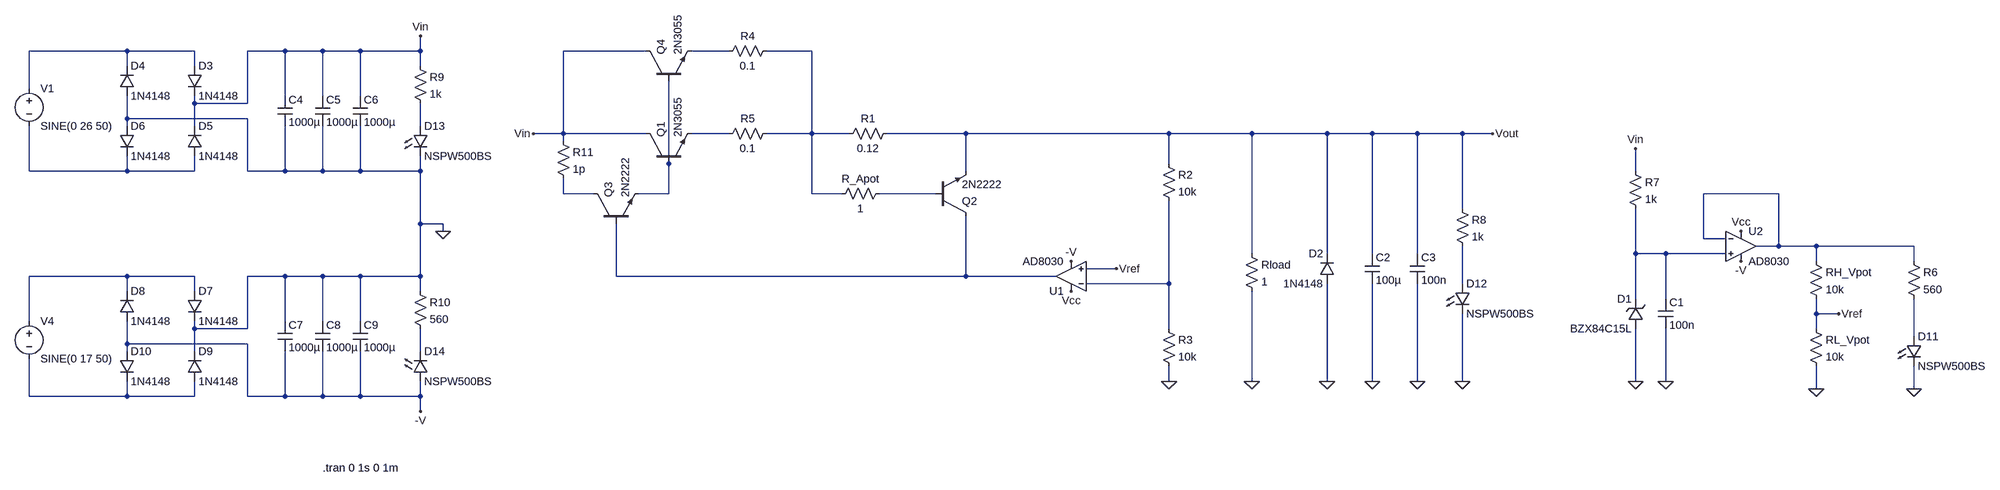
[diagram p0: schematic ALimentatore.asc]
ALimentatore.asc, the LTspice schematic file:
Version 4
SHEET 1 3308 680
WIRE -928 -320 -1136 -320
WIRE -784 -320 -928 -320
WIRE -592 -320 -672 -320
WIRE -512 -320 -592 -320
WIRE -432 -320 -512 -320
WIRE -304 -320 -304 -352
WIRE -304 -320 -432 -320
WIRE 176 -320 0 -320
WIRE 352 -320 272 -320
WIRE 528 -320 432 -320
WIRE -928 -288 -928 -320
WIRE -784 -288 -784 -320
WIRE -304 -288 -304 -320
WIRE -1136 -240 -1136 -320
WIRE -592 -224 -592 -320
WIRE -512 -224 -512 -320
WIRE -432 -224 -432 -320
WIRE -784 -208 -784 -224
WIRE -672 -208 -672 -320
WIRE -672 -208 -784 -208
WIRE -928 -176 -928 -224
WIRE -672 -176 -928 -176
WIRE -928 -160 -928 -176
WIRE -784 -160 -784 -208
WIRE -304 -160 -304 -208
WIRE 0 -144 0 -320
WIRE 0 -144 -64 -144
WIRE 176 -144 0 -144
WIRE 352 -144 272 -144
WIRE 528 -144 528 -320
WIRE 528 -144 432 -144
WIRE 608 -144 528 -144
WIRE 864 -144 688 -144
WIRE 1296 -144 864 -144
WIRE 1472 -144 1296 -144
WIRE 1632 -144 1472 -144
WIRE 1728 -144 1632 -144
WIRE 1824 -144 1728 -144
WIRE 1920 -144 1824 -144
WIRE 1984 -144 1920 -144
WIRE 0 -128 0 -144
WIRE 224 -80 224 -256
WIRE 1296 -80 1296 -144
WIRE -1136 -64 -1136 -160
WIRE -928 -64 -928 -96
WIRE -928 -64 -1136 -64
WIRE -784 -64 -784 -96
WIRE -784 -64 -928 -64
WIRE -672 -64 -672 -176
WIRE -592 -64 -592 -160
WIRE -592 -64 -672 -64
WIRE -512 -64 -512 -160
WIRE -512 -64 -592 -64
WIRE -432 -64 -432 -160
WIRE -432 -64 -512 -64
WIRE -304 -64 -304 -96
WIRE -304 -64 -432 -64
WIRE 864 -64 864 -144
WIRE 2288 -64 2288 -112
WIRE 0 -16 0 -48
WIRE 64 -16 0 -16
WIRE 224 -16 224 -80
WIRE 224 -16 160 -16
WIRE 528 -16 528 -144
WIRE 592 -16 528 -16
WIRE 800 -16 672 -16
WIRE 2592 -16 2432 -16
WIRE 1920 16 1920 -144
WIRE -304 48 -304 -64
WIRE -256 48 -304 48
WIRE -256 64 -256 48
WIRE 2432 80 2432 -16
WIRE 2480 80 2432 80
WIRE 2592 96 2592 -16
WIRE 2592 96 2544 96
WIRE 2672 96 2592 96
WIRE 2880 96 2672 96
WIRE 1472 112 1472 -144
WIRE 1632 112 1632 -144
WIRE 1728 112 1728 -144
WIRE 1824 112 1824 -144
WIRE 2288 112 2288 16
WIRE 2352 112 2288 112
WIRE 2480 112 2352 112
WIRE 2672 128 2672 96
WIRE 2880 128 2880 96
WIRE 1184 144 1120 144
WIRE -928 160 -1136 160
WIRE -784 160 -928 160
WIRE -592 160 -672 160
WIRE -512 160 -592 160
WIRE -432 160 -512 160
WIRE -304 160 -304 48
WIRE -304 160 -432 160
WIRE 112 160 112 48
WIRE 864 160 864 32
WIRE 864 160 112 160
WIRE 1056 160 864 160
WIRE 1296 176 1296 0
WIRE 1296 176 1120 176
WIRE 1920 176 1920 96
WIRE -928 192 -928 160
WIRE -784 192 -784 160
WIRE -304 192 -304 160
WIRE 2288 208 2288 112
WIRE 2352 208 2352 112
WIRE 2672 240 2672 208
WIRE 2720 240 2672 240
WIRE -1136 256 -1136 160
WIRE -592 256 -592 160
WIRE -512 256 -512 160
WIRE -432 256 -432 160
WIRE -784 272 -784 256
WIRE -672 272 -672 160
WIRE -672 272 -784 272
WIRE 1296 272 1296 176
WIRE 2672 272 2672 240
WIRE 2880 288 2880 208
WIRE -928 304 -928 256
WIRE -672 304 -928 304
WIRE -928 320 -928 304
WIRE -784 320 -784 272
WIRE -304 320 -304 272
WIRE 1296 384 1296 352
WIRE 1472 384 1472 192
WIRE 1632 384 1632 176
WIRE 1728 384 1728 176
WIRE 1824 384 1824 176
WIRE 1920 384 1920 240
WIRE 2288 384 2288 272
WIRE 2352 384 2352 272
WIRE 2672 400 2672 352
WIRE 2880 400 2880 352
WIRE -1136 416 -1136 336
WIRE -928 416 -928 384
WIRE -928 416 -1136 416
WIRE -784 416 -784 384
WIRE -784 416 -928 416
WIRE -672 416 -672 304
WIRE -592 416 -592 320
WIRE -592 416 -672 416
WIRE -512 416 -512 320
WIRE -512 416 -592 416
WIRE -432 416 -432 320
WIRE -432 416 -512 416
WIRE -304 416 -304 384
WIRE -304 416 -432 416
WIRE -304 448 -304 416
FLAG 1088 128 -V
FLAG -64 -144 Vin
FLAG 1184 144 Vref
FLAG 1296 384 0
FLAG 1472 384 0
FLAG 1088 192 Vcc
FLAG 2512 128 -V
FLAG 2512 64 Vcc
FLAG 2288 384 0
FLAG 2672 400 0
FLAG 2720 240 Vref
FLAG 1984 -144 Vout
FLAG 2352 384 0
FLAG 1632 384 0
FLAG 1728 384 0
FLAG 1824 384 0
FLAG -304 -352 Vin
FLAG -256 64 0
FLAG -304 448 -V
FLAG 2288 -112 Vin
FLAG 2880 400 0
FLAG 1920 384 0
SYMBOL opamps\\AD8030 1088 224 R180
SYMATTR InstName U1
SYMBOL npn 176 -80 R270
SYMATTR InstName Q1
SYMATTR Value 2N3055
SYMBOL npn 800 32 M180
SYMATTR InstName Q2
SYMATTR Value 2N2222
SYMBOL res 704 -160 R90
WINDOW 0 0 56 VBottom 2
WINDOW 3 32 56 VTop 2
SYMATTR InstName R1
SYMATTR Value 0.12
SYMBOL res 1280 -96 R0
SYMATTR InstName R2
SYMATTR Value 10k
SYMBOL res 1280 256 R0
SYMATTR InstName R3
SYMATTR Value 10k
SYMBOL res 1456 96 R0
SYMATTR InstName Rload
SYMATTR Value 1
SYMBOL npn 64 48 R270
SYMATTR InstName Q3
SYMATTR Value 2N2222
SYMBOL npn 176 -256 R270
SYMATTR InstName Q4
SYMATTR Value 2N3055
SYMBOL res 448 -336 R90
WINDOW 0 0 56 VBottom 2
WINDOW 3 32 56 VTop 2
SYMATTR InstName R4
SYMATTR Value 0.1
SYMBOL res 448 -160 R90
WINDOW 0 0 56 VBottom 2
WINDOW 3 32 56 VTop 2
SYMATTR InstName R5
SYMATTR Value 0.1
SYMBOL opamps\\AD8030 2512 32 R0
SYMATTR InstName U2
SYMBOL zener 2304 272 R180
WINDOW 0 24 64 Left 2
WINDOW 3 24 0 Left 2
SYMATTR InstName D1
SYMATTR Value BZX84C15L
SYMATTR Description Diode
SYMATTR Type diode
SYMBOL res 2272 -80 R0
SYMATTR InstName R7
SYMATTR Value 1k
SYMBOL res 2656 112 R0
SYMATTR InstName RH_Vpot
SYMATTR Value 10k
SYMBOL res 2656 256 R0
SYMATTR InstName RL_Vpot
SYMATTR Value 10k
SYMBOL res 688 -32 R90
WINDOW 0 0 56 VBottom 2
WINDOW 3 32 56 VTop 2
SYMATTR InstName R_Apot
SYMATTR Value 1
SYMBOL cap 2336 208 R0
SYMATTR InstName C1
SYMATTR Value 100n
SYMBOL diode 1648 176 R180
WINDOW 0 24 64 Left 2
WINDOW 3 24 0 Left 2
SYMATTR InstName D2
SYMATTR Value 1N4148
SYMBOL cap 1712 112 R0
SYMATTR InstName C2
SYMATTR Value 100µ
SYMBOL cap 1808 112 R0
SYMATTR InstName C3
SYMATTR Value 100n
SYMBOL voltage -1136 -256 R0
WINDOW 123 0 0 Left 0
WINDOW 39 0 0 Left 0
SYMATTR InstName V1
SYMATTR Value SINE(0 26 50)
SYMBOL voltage -1136 240 R0
WINDOW 123 0 0 Left 0
WINDOW 39 0 0 Left 0
SYMATTR InstName V4
SYMATTR Value SINE(0 17 50)
SYMBOL diode -800 -288 R0
SYMATTR InstName D3
SYMATTR Value 1N4148
SYMBOL diode -944 -224 M180
WINDOW 0 24 64 Left 2
WINDOW 3 24 0 Left 2
SYMATTR InstName D4
SYMATTR Value 1N4148
SYMBOL diode -800 -96 M180
WINDOW 0 24 64 Left 2
WINDOW 3 24 0 Left 2
SYMATTR InstName D5
SYMATTR Value 1N4148
SYMBOL diode -944 -160 R0
SYMATTR InstName D6
SYMATTR Value 1N4148
SYMBOL cap -608 -224 R0
SYMATTR InstName C4
SYMATTR Value 1000µ
SYMBOL cap -528 -224 R0
SYMATTR InstName C5
SYMATTR Value 1000µ
SYMBOL cap -448 -224 R0
SYMATTR InstName C6
SYMATTR Value 1000µ
SYMBOL diode -800 192 R0
SYMATTR InstName D7
SYMATTR Value 1N4148
SYMBOL diode -944 256 M180
WINDOW 0 24 64 Left 2
WINDOW 3 24 0 Left 2
SYMATTR InstName D8
SYMATTR Value 1N4148
SYMBOL diode -800 384 M180
WINDOW 0 24 64 Left 2
WINDOW 3 24 0 Left 2
SYMATTR InstName D9
SYMATTR Value 1N4148
SYMBOL diode -944 320 R0
SYMATTR InstName D10
SYMATTR Value 1N4148
SYMBOL cap -608 256 R0
SYMATTR InstName C7
SYMATTR Value 1000µ
SYMBOL cap -528 256 R0
SYMATTR InstName C8
SYMATTR Value 1000µ
SYMBOL cap -448 256 R0
SYMATTR InstName C9
SYMATTR Value 1000µ
SYMBOL LED 2864 288 R0
SYMATTR InstName D11
SYMATTR Value NSPW500BS
SYMATTR Description Diode
SYMATTR Type diode
SYMBOL res 2864 112 R0
SYMATTR InstName R6
SYMATTR Value 560
SYMBOL LED 1904 176 R0
SYMATTR InstName D12
SYMATTR Value NSPW500BS
SYMATTR Description Diode
SYMATTR Type diode
SYMBOL res 1904 0 R0
SYMATTR InstName R8
SYMATTR Value 1k
SYMBOL LED -320 -160 R0
SYMATTR InstName D13
SYMATTR Value NSPW500BS
SYMATTR Description Diode
SYMATTR Type diode
SYMBOL res -320 -304 R0
SYMATTR InstName R9
SYMATTR Value 1k
SYMBOL LED -320 384 M180
WINDOW 0 24 64 Left 2
WINDOW 3 24 0 Left 2
SYMATTR InstName D14
SYMATTR Value NSPW500BS
SYMATTR Description Diode
SYMATTR Type diode
SYMBOL res -320 176 R0
SYMATTR InstName R10
SYMATTR Value 560
SYMBOL res -16 -144 R0
SYMATTR InstName R11
SYMATTR Value 1p
TEXT -512 568 Left 2 !.tran 0 1s 0 1m

The netlist it stands for:
* ALimentatore.asc
XU1 Vref N014 Vcc -V N013 AD8040  ; AD8030, pins In+ In- V+ V- OUT
Q1 Vin N006 N005 0 2N3055
Q2 N013 N009 Vout 0 2N2222
R1 Vout N003 0.12
R2 Vout N014 10k
R3 N014 0 10k
Rload Vout 0 1
Q3 N008 N013 N006 0 2N2222
Q4 Vin N006 N002 0 2N3055
R4 N003 N002 0.1
R5 N003 N005 0.1
XU2 N011 N010 Vcc -V N010 AD8040  ; AD8030, pins In+ In- V+ V- OUT
D1 0 N011 BZX84C15L
R7 Vin N011 1k
RH_Vpot N010 Vref 10k
RL_Vpot Vref 0 10k
R_Apot N009 N003 1
C1 N011 0 100n
D2 0 Vout 1N4148
C2 Vout 0 100µ
C3 Vout 0 100n
V1 N001 N007 SINE(0 26 50)
V4 N012 N018 SINE(0 17 50)
D3 N001 Vin 1N4148
D4 0 N001 1N4148
D5 N007 Vin 1N4148
D6 0 N007 1N4148
C4 Vin 0 1000µ
C5 Vin 0 1000µ
C6 Vin 0 1000µ
D7 N012 0 1N4148
D8 -V N012 1N4148
D9 N018 0 1N4148
D10 -V N018 1N4148
C7 0 -V 1000µ
C8 0 -V 1000µ
C9 0 -V 1000µ
D11 N016 0 NSPW500BS
R6 N010 N016 560
D12 N015 0 NSPW500BS
R8 Vout N015 1k
D13 N004 0 NSPW500BS
R9 Vin N004 1k
D14 -V N017 NSPW500BS
R10 0 N017 560
R11 Vin N008 1p
.model D D
.lib standard.dio
.model NPN NPN
.model PNP PNP
.lib standard.bjt
.tran 0 1s 0 1m
.lib ADI.lib
.backanno
.end